# Altium schematic sheet ADL S PCH 600 PWR.schdoc
size 420 x 298 mm; Symbol: Sheet-Symbol_A3; Company: 嘉立创EDA; Version: V1.0; Page Size: A3; @Project Name: 【全网首发】X86电脑主板_copy; @Page Count: 10; @Update Date: 2025-10-09; @Create Date: 2025-10-09; @Schematic Name: SCHEMATIC1_1; @Page No: 0; @Page Name: ADL S PCH 600 PWR; Device: Sheet-Symbol_A3
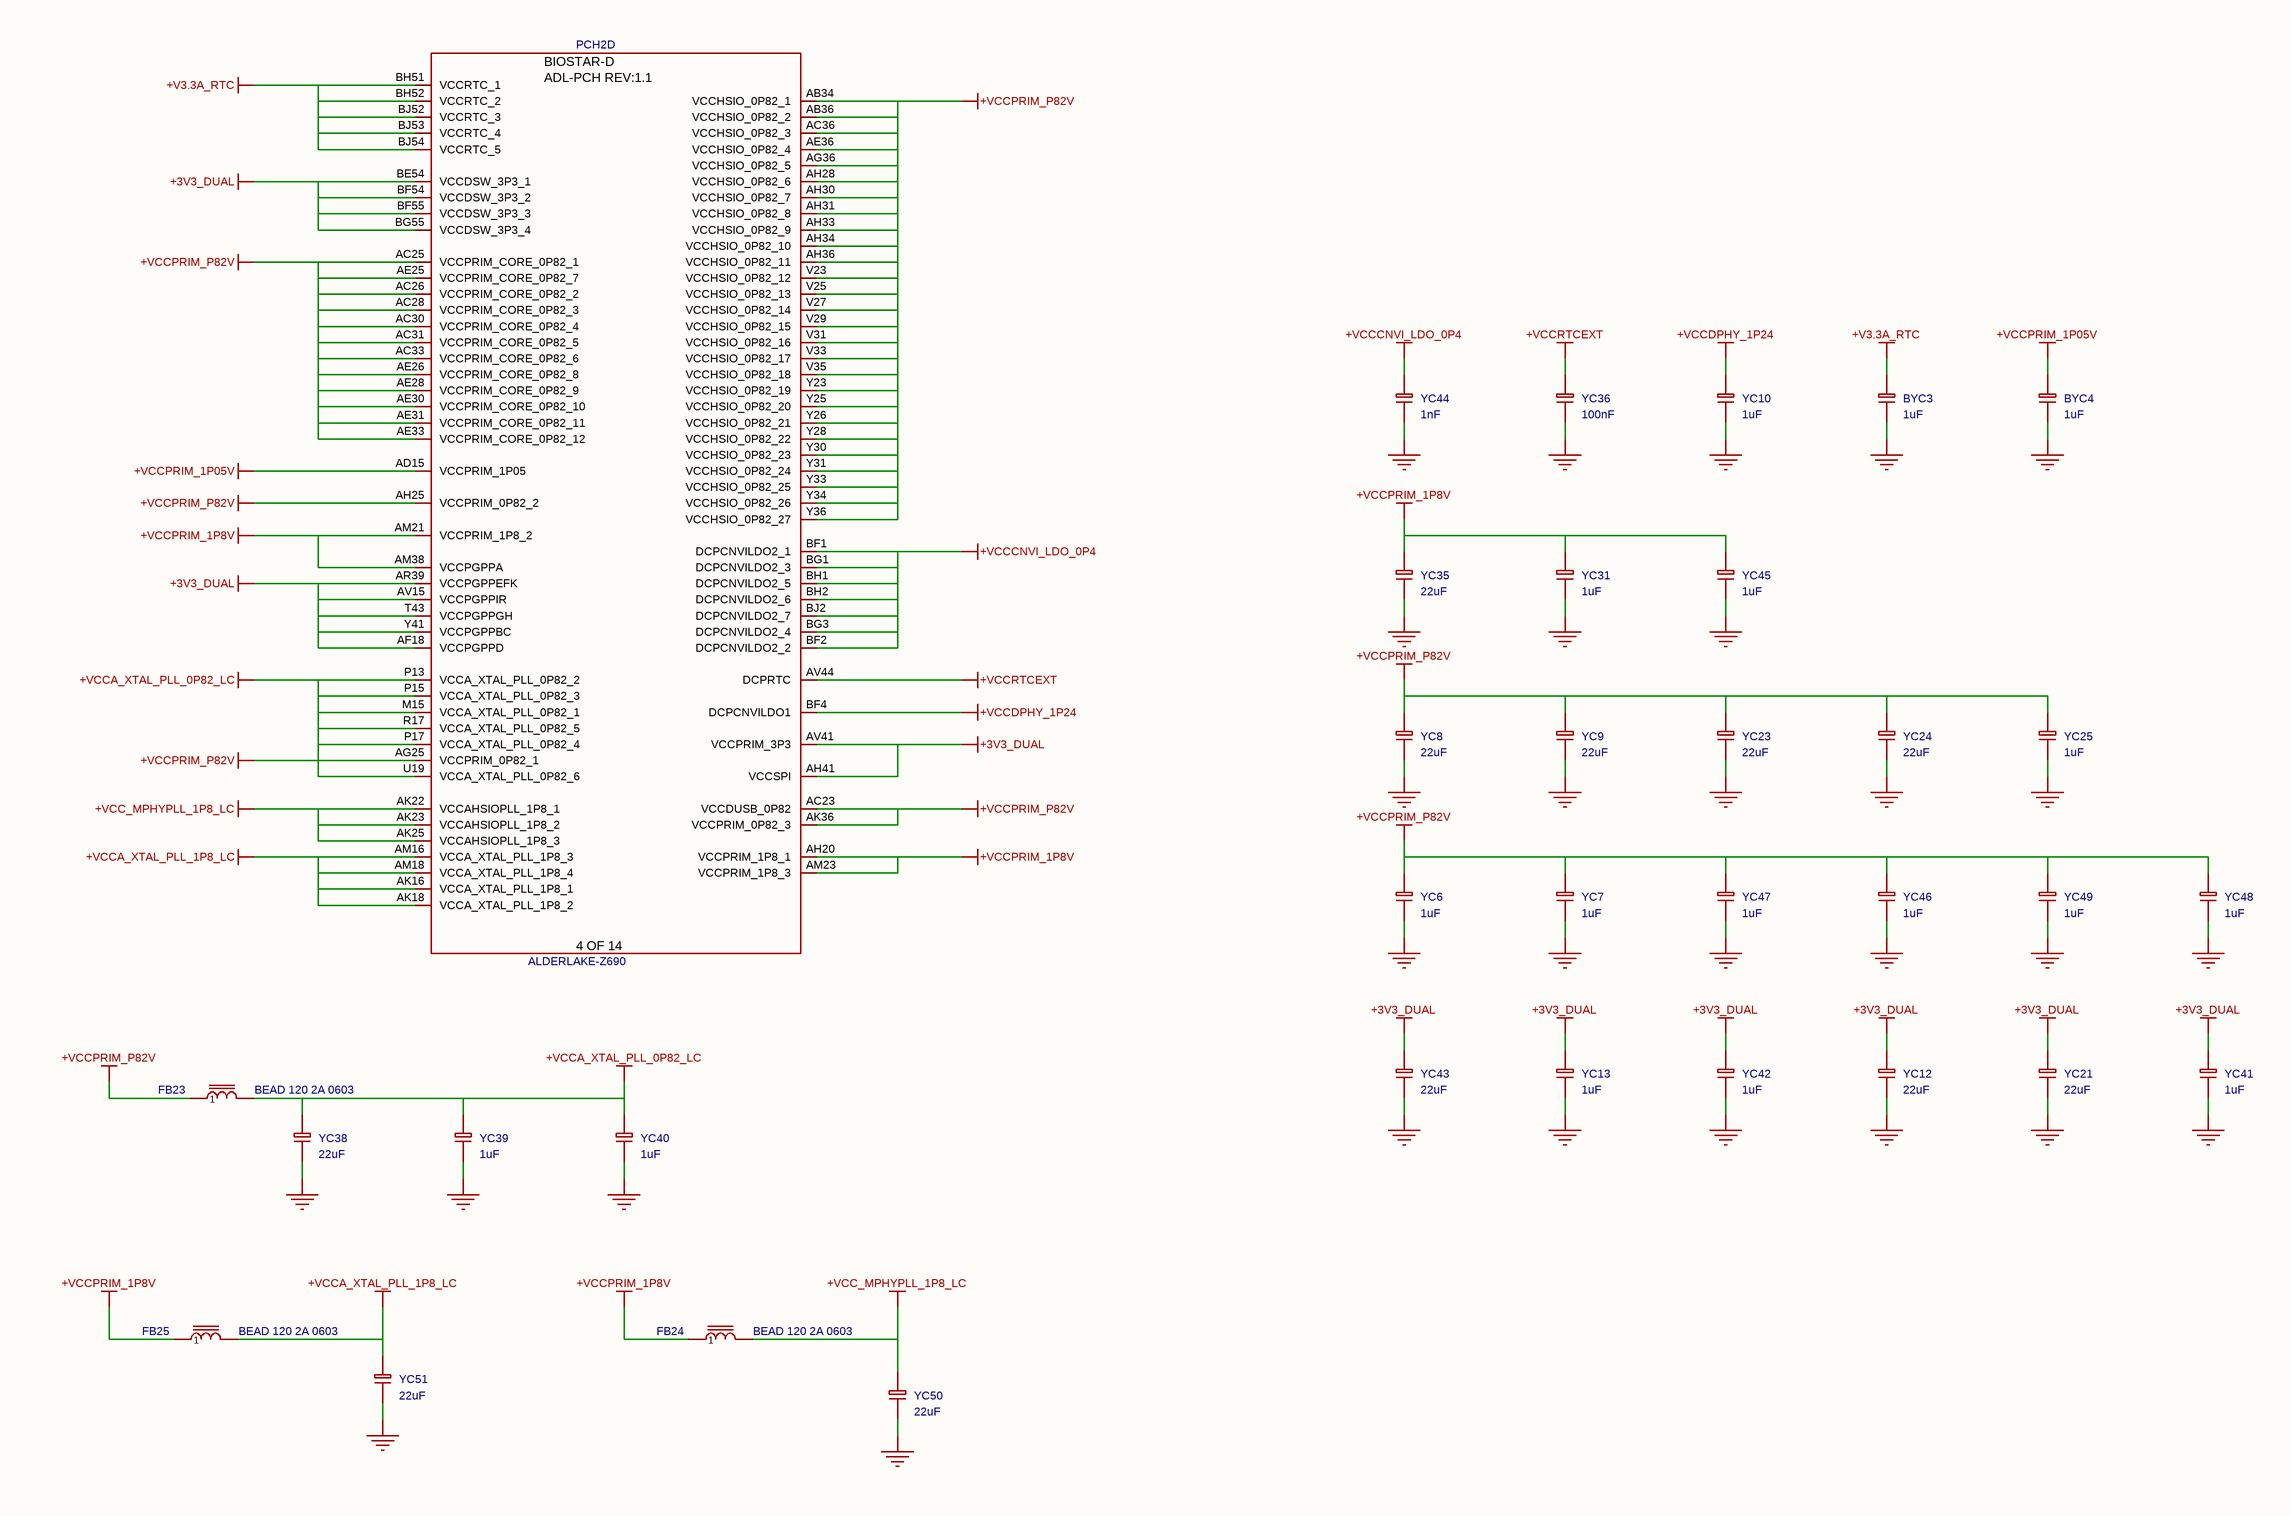
[diagram p0: ADL S PCH 600 PWR.schdoc]

## Parts
BYC3  1uF  [C0402_1]
BYC4  1uF  [C0402]
FB23  value BEAD 120 2A 0603  [FB0603]  (hidden comment: FERRITE BEAD)
FB24  value BEAD 120 2A 0603  [FB0603_2]  (hidden comment: FERRITE BEAD)
FB25  value BEAD 120 2A 0603  [FB0603]  (hidden comment: FERRITE BEAD)
PCH2  value ALDERLAKE-Z690  [BGA1045_28X25MM-ADL]  (hidden comment: ADL_S_PCH_EXT_4)  (part D of 14)
YC6  1uF  [C0402]
YC7  1uF  [C0402_1]
YC8  22uF  [C0603_2]
YC9  22uF  [C0603_2]
YC10  1uF  [C0402_2]
YC12  22uF  [C0603_2]
YC13  1uF  [C0402]
YC21  22uF  [C0603_2]
YC23  22uF  [C0603_1]
YC24  22uF  [C0603_1]
YC25  1uF  [C0402_1]
YC31  1uF  [C0402_3]
YC35  22uF  [C0603_2]
YC36  100nF  [C0402]
YC38  22uF  [C0603_1]
YC39  1uF  [C0402_3]
YC40  1uF  [C0402_3]
YC41  1uF  [C0402_2]
YC42  1uF  [C0402_1]
YC43  22uF  [C0603_2]
YC44  1nF  [C0402_2]
YC45  1uF  [C0402_3]
YC46  1uF  [C0402_2]
YC47  1uF  [C0402]
YC48  1uF  [C0402_1]
YC49  1uF  [C0402_1]
YC50  22uF  [C0603_2]
YC51  22uF  [C0603_2]

## Nets
+3V3_DUAL: PCH2.AF18(VCCPGPPD) PCH2.AH41(VCCSPI) PCH2.AR39(VCCPGPPEFK) PCH2.AV15(VCCPGPPIR) PCH2.AV41(VCCPRIM_3P3) PCH2.BE54(VCCDSW_3P3_1) PCH2.BF54(VCCDSW_3P3_2) PCH2.BF55(VCCDSW_3P3_3) PCH2.BG55(VCCDSW_3P3_4) PCH2.T43(VCCPGPPGH) PCH2.Y41(VCCPGPPBC) YC12.1 YC13.1 YC21.1 YC41.1 YC42.1 YC43.1
+V3.3A_RTC: BYC3.1 PCH2.BH51(VCCRTC_1) PCH2.BH52(VCCRTC_2) PCH2.BJ52(VCCRTC_3) PCH2.BJ53(VCCRTC_4) PCH2.BJ54(VCCRTC_5)
+VCC_MPHYPLL_1P8_LC: FB24.2 PCH2.AK22(VCCAHSIOPLL_1P8_1) PCH2.AK23(VCCAHSIOPLL_1P8_2) PCH2.AK25(VCCAHSIOPLL_1P8_3) YC50.1
+VCCA_XTAL_PLL_0P82_LC: FB23.2 PCH2.M15(VCCA_XTAL_PLL_0P82_1) PCH2.P13(VCCA_XTAL_PLL_0P82_2) PCH2.P15(VCCA_XTAL_PLL_0P82_3) PCH2.P17(VCCA_XTAL_PLL_0P82_4) PCH2.R17(VCCA_XTAL_PLL_0P82_5) PCH2.U19(VCCA_XTAL_PLL_0P82_6) YC38.1 YC39.1 YC40.1
+VCCA_XTAL_PLL_1P8_LC: FB25.2 PCH2.AK16(VCCA_XTAL_PLL_1P8_1) PCH2.AK18(VCCA_XTAL_PLL_1P8_2) PCH2.AM16(VCCA_XTAL_PLL_1P8_3) PCH2.AM18(VCCA_XTAL_PLL_1P8_4) YC51.1
+VCCCNVI_LDO_0P4: PCH2.BF1(DCPCNVILDO2_1) PCH2.BF2(DCPCNVILDO2_2) PCH2.BG1(DCPCNVILDO2_3) PCH2.BG3(DCPCNVILDO2_4) PCH2.BH1(DCPCNVILDO2_5) PCH2.BH2(DCPCNVILDO2_6) PCH2.BJ2(DCPCNVILDO2_7) YC44.1
+VCCDPHY_1P24: PCH2.BF4(DCPCNVILDO1) YC10.1
+VCCPRIM_1P05V: BYC4.1 PCH2.AD15(VCCPRIM_1P05)
+VCCPRIM_1P8V: FB24.1 FB25.1 PCH2.AH20(VCCPRIM_1P8_1) PCH2.AM21(VCCPRIM_1P8_2) PCH2.AM23(VCCPRIM_1P8_3) PCH2.AM38(VCCPGPPA) YC31.1 YC35.1 YC45.1
+VCCPRIM_P82V: FB23.1 PCH2.AB34(VCCHSIO_0P82_1) PCH2.AB36(VCCHSIO_0P82_2) PCH2.AC23(VCCDUSB_0P82) PCH2.AC25(VCCPRIM_CORE_0P82_1) PCH2.AC26(VCCPRIM_CORE_0P82_2) PCH2.AC28(VCCPRIM_CORE_0P82_3) PCH2.AC30(VCCPRIM_CORE_0P82_4) PCH2.AC31(VCCPRIM_CORE_0P82_5) PCH2.AC33(VCCPRIM_CORE_0P82_6) PCH2.AC36(VCCHSIO_0P82_3) PCH2.AE25(VCCPRIM_CORE_0P82_7) PCH2.AE26(VCCPRIM_CORE_0P82_8) PCH2.AE28(VCCPRIM_CORE_0P82_9) PCH2.AE30(VCCPRIM_CORE_0P82_10) PCH2.AE31(VCCPRIM_CORE_0P82_11) PCH2.AE33(VCCPRIM_CORE_0P82_12) PCH2.AE36(VCCHSIO_0P82_4) PCH2.AG25(VCCPRIM_0P82_1) PCH2.AG36(VCCHSIO_0P82_5) PCH2.AH25(VCCPRIM_0P82_2) PCH2.AH28(VCCHSIO_0P82_6) PCH2.AH30(VCCHSIO_0P82_7) PCH2.AH31(VCCHSIO_0P82_8) PCH2.AH33(VCCHSIO_0P82_9) PCH2.AH34(VCCHSIO_0P82_10) PCH2.AH36(VCCHSIO_0P82_11) PCH2.AK36(VCCPRIM_0P82_3) PCH2.V23(VCCHSIO_0P82_12) PCH2.V25(VCCHSIO_0P82_13) PCH2.V27(VCCHSIO_0P82_14) PCH2.V29(VCCHSIO_0P82_15) PCH2.V31(VCCHSIO_0P82_16) PCH2.V33(VCCHSIO_0P82_17) PCH2.V35(VCCHSIO_0P82_18) PCH2.Y23(VCCHSIO_0P82_19) PCH2.Y25(VCCHSIO_0P82_20) PCH2.Y26(VCCHSIO_0P82_21) PCH2.Y28(VCCHSIO_0P82_22) PCH2.Y30(VCCHSIO_0P82_23) PCH2.Y31(VCCHSIO_0P82_24) PCH2.Y33(VCCHSIO_0P82_25) PCH2.Y34(VCCHSIO_0P82_26) PCH2.Y36(VCCHSIO_0P82_27) YC6.1 YC7.1 YC8.1 YC9.1 YC23.1 YC24.1 YC25.1 YC46.1 YC47.1 YC48.1 YC49.1
+VCCRTCEXT: PCH2.AV44(DCPRTC) YC36.1
GND: BYC3.2 BYC4.2 YC6.2 YC7.2 YC8.2 YC9.2 YC10.2 YC12.2 YC13.2 YC21.2 YC23.2 YC24.2 YC25.2 YC31.2 YC35.2 YC36.2 YC38.2 YC39.2 YC40.2 YC41.2 YC42.2 YC43.2 YC44.2 YC45.2 YC46.2 YC47.2 YC48.2 YC49.2 YC50.2 YC51.2

## Notes on the sheet
- 更新日期
- 2025-10-09
- 原理图
- 图页
- SCHEMATIC1_1
- ADL S PCH 600 PWR
- 创建日期
- 物料编码
- 审阅
- 绘制
- 【全网首发】X86电脑主板_copy
- 版本
- V1.0
- 尺寸
- A3
- 页
- 0
- 嘉立创EDA
- 共
- 10
- (in symbol ADL_S_PCH_EXT_4, part D) BIOSTAR-D; ADL-PCH REV:1.1; 4 OF 14

## Library data of the parts
BYC3 YC7 YC10 YC25 YC31 YC39-YC42 YC45 YC46 YC48 YC49 = CL05A105KA5NQNC: 容值:1uF;精度:±10%;额定电压:25V;材质(温度系数):X5R;; Manufacturer: SAMSUNG(三星); Symbol: CAP; PCB Footprint: C0402; Tolerance: ±10%; ModelId: 36a51122f27c49738f86b3bfa98863e0; AddInBom: yes; Voltage Rated: 25V; ModelName: C0402_L1.0-W0.5-H0.5; ModelTransform: 39.37,19.685,0,0,0,0,0,0,0; Temperature Coefficient: X5R; Device: CL05A105KA5NQNC; Value: 1uF; Supplier: LCSC; Datasheet: https://atta.szlcsc.com/upload/public/pdf/source/20160103/1457707735223.pdf; SupplierPart: C52923; ConvertToPcb: yes; LCSC Part Name: 1uF ±10% 25V; JLCPCB Part Class: Basic Part; ManufacturerPart: CL05A105KA5NQNC; Supplier Footprint: 0402
  BYC3 YC7 YC25 YC42 YC48 YC49: FootprintName: C0402_1
  YC10 YC41 YC46: FootprintName: C0402_2
  YC31 YC39 YC40 YC45: FootprintName: C0402_3
BYC4 YC6 YC13 YC47 = CL05A105KA5NQNC: 容值:1uF;精度:±10%;额定电压:25V;材质(温度系数):X5R;; Manufacturer: SAMSUNG(三星); Symbol: CAP; Tolerance: ±10%; ModelId: 36a51122f27c49738f86b3bfa98863e0; AddInBom: yes; Voltage Rated: 25V; ModelName: C0402_L1.0-W0.5-H0.5; ModelTransform: 39.37,19.685,0,0,0,0,0,0,0; Temperature Coefficient: X5R; Device: CL05A105KA5NQNC; PCB Footprint: C0402; Value: 1uF; Supplier: LCSC; Datasheet: https://atta.szlcsc.com/upload/public/pdf/source/20160103/1457707735223.pdf; FootprintName: C0402; SupplierPart: C52923; ConvertToPcb: yes; LCSC Part Name: 1uF ±10% 25V; JLCPCB Part Class: Basic Part; ManufacturerPart: CL05A105KA5NQNC; Supplier Footprint: 0402
FB23 FB25 = FERRITE BEAD_1: Check: false; AddInBom: yes; Device: FERRITE BEAD_1; Symbol: FERRITE BEAD; FootprintName: FB0603; ConvertToPcb: yes
FB24 = FERRITE BEAD: Check: false; AddInBom: yes; Device: FERRITE BEAD; Symbol: FERRITE BEAD; FootprintName: FB0603_2; ConvertToPcb: yes
PCH2 = ADL_S_PCH_EXT_4: AddInBom: yes; Device: ADL_S_PCH_EXT_4; Symbol: ADL_S_PCH_EXT_4; FootprintName: BGA1045_28X25MM-ADL; ConvertToPcb: yes
YC8 YC9 YC12 YC21 YC23 YC24 YC35 YC38 YC43 YC50 YC51 = CL10A226MQ8NRNC_1: 容值:22uF;精度:±20%;额定电压:6.3V;材质(温度系数):X5R;; Manufacturer: SAMSUNG(三星); Symbol: CAP; PCB Footprint: C0603; Tolerance: ±20%; ModelId: ac125912035d415993ca9572d50418b1; AddInBom: yes; Voltage Rated: 6.3V; ModelName: C0603_L1.6-W0.8-H0.8; ModelTransform: 62.992,31.496,0,0,0,0,0,0,0; Temperature Coefficient: X5R; Device: CL10A226MQ8NRNC_1; Value: 22uF; Supplier: LCSC; Datasheet: https://atta.szlcsc.com/upload/public/pdf/source/20160103/1457707740762.pdf; SupplierPart: C59461; ConvertToPcb: yes; LCSC Part Name: 22uF ±20% 6.3V; JLCPCB Part Class: Basic Part; ManufacturerPart: CL10A226MQ8NRNC; Supplier Footprint: 0603
  YC8 YC9 YC12 YC21 YC35 YC43 YC50 YC51: FootprintName: C0603_2
  YC23 YC24 YC38: FootprintName: C0603_1
YC36 = CL05B104KO5NNNC: 容值:100nF;精度:±10%;额定电压:16V;材质(温度系数):X7R;; Manufacturer: SAMSUNG(三星); Symbol: CAP; Tolerance: ±10%; ModelId: 36a51122f27c49738f86b3bfa98863e0; AddInBom: yes; Voltage Rated: 16V; ModelName: C0402_L1.0-W0.5-H0.5; ModelTransform: 39.37,19.685,0,0,0,0,0,0,0; Temperature Coefficient: X7R; Device: CL05B104KO5NNNC; PCB Footprint: C0402; Value: 100nF; Supplier: LCSC; Datasheet: https://atta.szlcsc.com/upload/public/pdf/source/20160103/1457707674891.pdf; FootprintName: C0402; SupplierPart: C1525; ConvertToPcb: yes; LCSC Part Name: 100nF ±10% 16V; JLCPCB Part Class: Basic Part; ManufacturerPart: CL05B104KO5NNNC; Supplier Footprint: 0402
YC44 = 0402B102K500NT: 容值:1nF;精度:±10%;额定电压:50V;材质(温度系数):X7R;; Manufacturer: FH(风华); 3D Model: 36a51122f27c49738f86b3bfa98863e0; Symbol: CAP; PCB Footprint: C0402; Tolerance: ±10%; AddInBom: yes; Voltage Rated: 50V; ModelName: C0402_L1.0-W0.5-H0.5; ModelTransform: 39.37,19.685,0,0,0,0,0,0,0; Temperature Coefficient: X7R; Device: 0402B102K500NT; Value: 1nF; Supplier: LCSC; Datasheet: https://atta.szlcsc.com/upload/public/pdf/source/20200305/C486355_26A10D38EF8C2A5C37091D0039909270.pdf; FootprintName: C0402_2; SupplierPart: C1523; ConvertToPcb: yes; LCSC Part Name: 1nF ±10% 50V; JLCPCB Part Class: Basic Part; ManufacturerPart: 0402B102K500NT; Supplier Footprint: 0402